# Altium schematic sheet 2.电源.SchDoc
size 297 x 209 mm; SheetNumber: 2; SheetTotal: 13
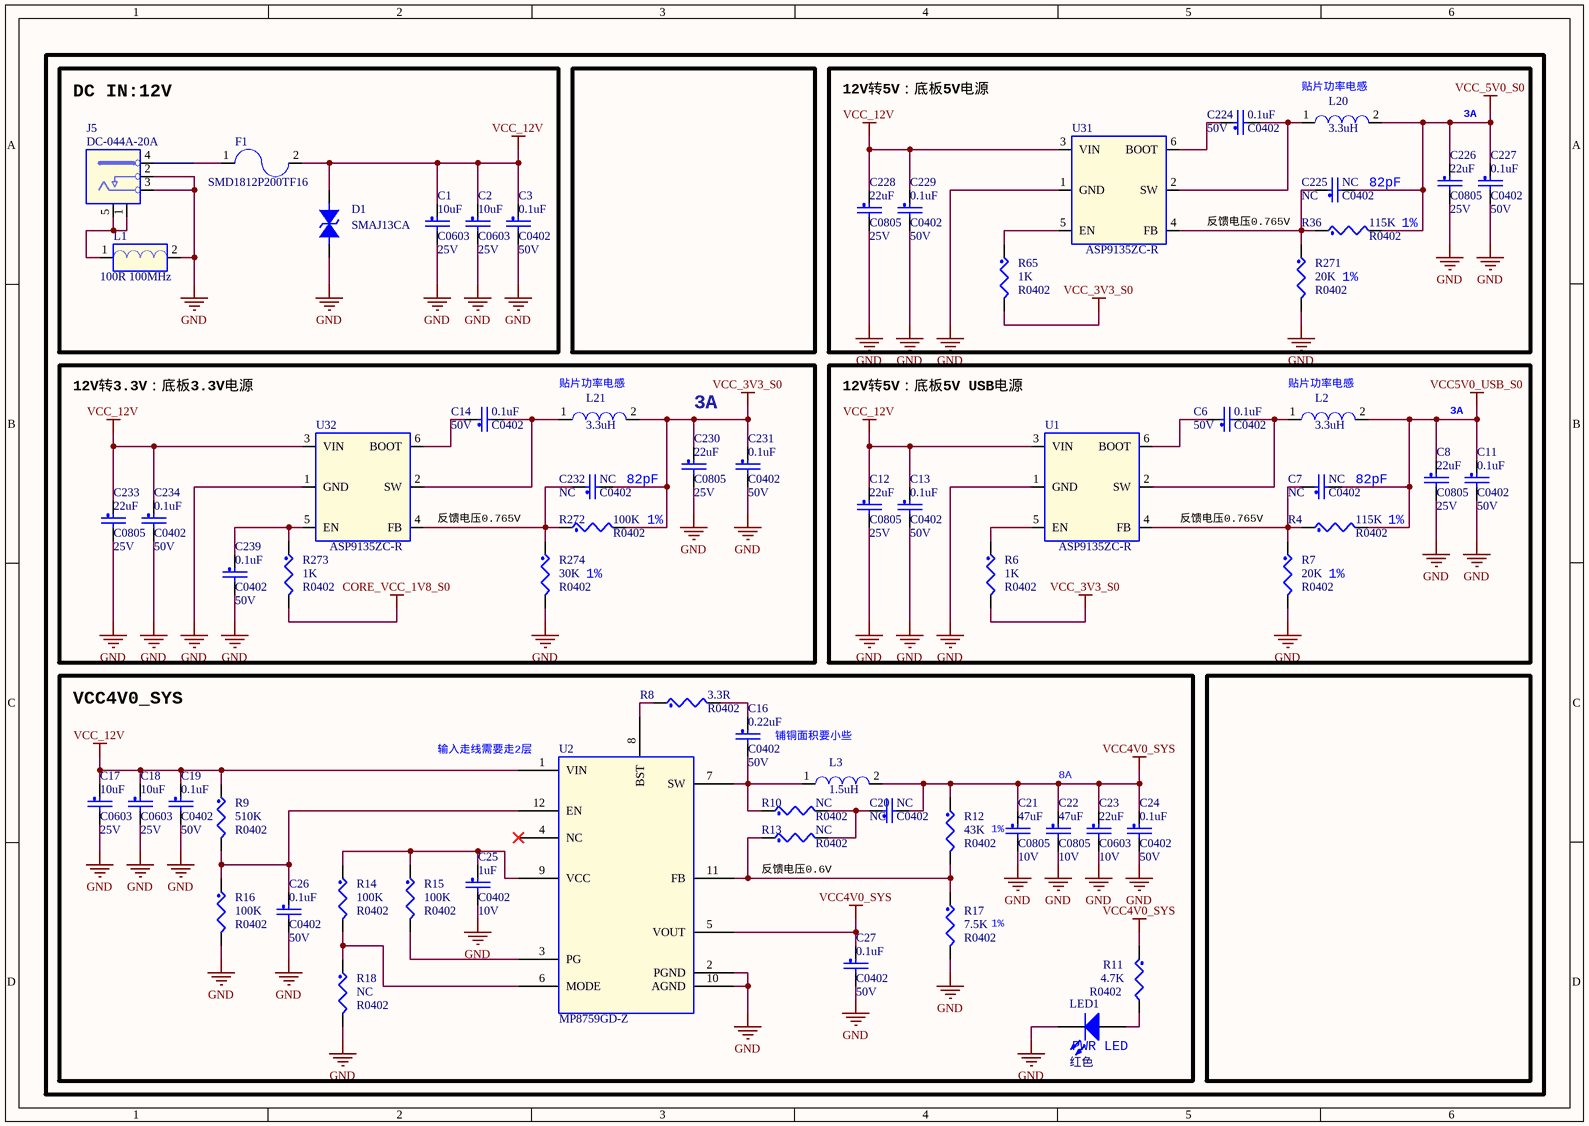
[diagram p0: 2.电源.SchDoc]

## Parts
C1  10uF  Voltage: 25V  [C0603]
C2  10uF  Voltage: 25V  [C0603]
C3  0.1uF  Voltage: 50V  [C0402]
C6  0.1uF  Voltage: 50V  [C0402]
C7  NC  [C0402]
C8  22uF  Voltage: 25V  [C0805]
C11  0.1uF  Voltage: 50V  [C0402]
C12  22uF  Voltage: 25V  [C0805]
C13  0.1uF  Voltage: 50V  [C0402]
C14  0.1uF  Voltage: 50V  [C0402]
C16  0.22uF  Voltage: 50V  [C0402]
C17  10uF  Voltage: 25V  [C0603]
C18  10uF  Voltage: 25V  [C0603]
C19  0.1uF  Voltage: 50V  [C0402]
C20  NC  [C0402]
C21  47uF  Voltage: 10V  [C0805]
C22  47uF  Voltage: 10V  [C0805]
C23  22uF  Voltage: 10V  [C0603]
C24  0.1uF  Voltage: 50V  [C0402]
C25  1uF  Voltage: 10V  [C0402]
C26  0.1uF  Voltage: 50V  [C0402]
C27  0.1uF  Voltage: 50V  [C0402]
C224  0.1uF  Voltage: 50V  [C0402]
C225  NC  [C0402]
C226  22uF  Voltage: 25V  [C0805]
C227  0.1uF  Voltage: 50V  [C0402]
C228  22uF  Voltage: 25V  [C0805]
C229  0.1uF  Voltage: 50V  [C0402]
C230  22uF  Voltage: 25V  [C0805]
C231  0.1uF  Voltage: 50V  [C0402]
C232  NC  [C0402]
C233  22uF  Voltage: 25V  [C0805]
C234  0.1uF  Voltage: 50V  [C0402]
C239  0.1uF  Voltage: 50V  [C0402]
D1  SMAJ13CA  [SMA_CA]
F1  SMD1812P200TF16  [F1812]
J5  DC-044A-20A  [dc_in_th_3p_10r1x11r6]
L1  100R 100MHz  [L0603]
L2  3.3uH  [l4520]
L3  1.5uH  [L0518]
L20  3.3uH  [l4520]
L21  3.3uH  [l4520]
LED1  红色  [LED0603_R]
R4  115K  [R0402]
R6  1K  [R0402]
R7  20K  [R0402]
R8  3.3R  [R0402]
R9  510K  [R0402]
R10  NC  [R0402]
R11  4.7K  [R0402]
R12  43K  [R0402]
R13  NC  [R0402]
R14  100K  [R0402]
R15  100K  [R0402]
R16  100K  [R0402]
R17  7.5K  [R0402]
R18  NC  [R0402]
R36  115K  [R0402]
R65  1K  [R0402]
R271  20K  [R0402]
R272  100K  [R0402]
R273  1K  [R0402]
R274  30K  [R0402]
U1  ASP9135ZC-R  [SOT23_6]
U2  MP8759GD-Z  [QFN12-2R00X3R00]
U31  ASP9135ZC-R  [SOT23_6]
U32  ASP9135ZC-R  [SOT23_6]

## Blocks framed on the sheet
DC IN:12V: C1-C3 D1 F1 J5 L1
12V转5V：底板5V电源: C224-C229 L20 R36 R65 R271 U31
3A: C14 C230-C234 C239 L21 R272-R274 U32
12V转5V：底板5V USB电源: C6-C8 C11-C13 L2 R4 R6 R7 U1
VCC4V0_SYS: C16-C27 L3 LED1 R8-R18 U2

## Nets
CORE_VCC_1V8_S0: R273.2
GND: C1.2 C2.2 C3.2 C8.2 C11.2 C12.2 C13.2 C17.2 C18.2 C19.2 C21.2 C22.2 C23.2 C24.2 C25.2 C26.2 C27.2 C226.2 C227.2 C228.2 C229.2 C230.2 C231.2 C233.2 C234.2 C239.2 D1.1 J5.2 J5.3 L1.2 LED1.2(K) R7.2 R16.2 R17.2 R18.2 R271.2 R274.2 U1.1(GND) U2.2(PGND) U2.10(AGND) U31.1(GND) U32.1(GND)
VCC4V0_SYS: C20.2 C21.1 C22.1 C23.1 C24.1 C27.1 L3.2 R11.1 R12.1 U2.5(VOUT)
VCC5V0_USB_S0: C7.2 C8.1 C11.1 L2.2 R4.2
VCC_3V3_S0: C230.1 C231.1 C232.2 L21.2 R6.2 R65.2 R272.2
VCC_5V0_S0: C225.2 C226.1 C227.1 L20.2 R36.2
VCC_12V: C1.1 C2.1 C3.1 C12.1 C13.1 C17.1 C18.1 C19.1 C228.1 C229.1 C233.1 C234.1 D1.2 F1.2 R9.1 U1.3(VIN) U2.1(VIN) U31.3(VIN) U32.3(VIN)
NetC6_1: C6.1 U1.6(BOOT)
NetC6_2: C6.2 L2.1 U1.2(SW)
NetC7_1: C7.1 R4.1 R7.1 U1.4(FB)
NetC14_1: C14.1 U32.6(BOOT)
NetC14_2: C14.2 L21.1 U32.2(SW)
NetC16_1: C16.1 R8.2
NetC16_2: C16.2 L3.1 R10.1 U2.7(SW)
NetC20_1: C20.1 R10.2 R13.2
NetC25_1: C25.1 R14.1 R15.1 U2.9(VCC)
NetC26_1: C26.1 R9.2 R16.1 U2.12(EN)
NetC224_1: C224.1 U31.6(BOOT)
NetC224_2: C224.2 L20.1 U31.2(SW)
NetC225_1: C225.1 R36.1 R271.1 U31.4(FB)
NetC232_1: C232.1 R272.1 R274.1 U32.4(FB)
NetC239_1: C239.1 R273.1 U32.5(EN)
NetF1_1: F1.1 J5.4
NetJ5_1: J5.1 J5.5 L1.1
NetLED1_1: LED1.1(A) R11.2
NetR6_1: R6.1 U1.5(EN)
NetR8_1: R8.1 U2.8(BST)
NetR12_2: R12.2 R13.1 R17.1 U2.11(FB)
NetR14_2: R14.2 R18.1 U2.6(MODE)
NetR15_2: R15.2 U2.3(PG)
NetR65_1: R65.1 U31.5(EN)

Not connected (* = marked no-connect by the designer): U2 4(NC)*

## Notes on the sheet
- (near L20) 贴片功率电感
- 3A
- 82pF
- 反馈电压0.765V
- 1%
- 12V转3.3V：底板3.3V电源
- (near L21) 贴片功率电感
- (near L2) 贴片功率电感
- (near U32) 反馈电压0.765V
- 铺铜面积要小些
- 输入走线需要走2层
- 8A
- (near R13) 反馈电压0.6V
- (near C21) 1%
- (near R17) 1%
- (near LED1) PWR LED

## Library data of the parts
C1 C2 C17 C18 = CAP_NP: CLASS: DISCRETE; 生命周期: 量产; 价格: 0.109811; 规格书: 三星电容.pdf; 类别: 贴片电容0603; 品牌: 三星; 条码: EBF29060171; 规格编号: CL10A106MA8NRNC; 规格: 贴片电容10uF 20% 25V X5R 0603; PCB Footprint: C0603
C3 C24 C27 C229 = CAP_NP: CLASS: DISCRETE; 规格: 贴片电容0.1uF 10% 50V X5R 0402; 规格编号: 0402X104K500NT; 条码: EBF29060118; 品牌: 风华; 类别: 贴片电容0402; 规格书: 风华电容.pdf; 价格: 0.029826; 生命周期: 量产; PCB Footprint: C0402
C6 C11 C13 C14 C19 C26 C224 C227 C231 C234 C239 = CAP_NP: CLASS: DISCRETE; 生命周期: 量产; 价格: 0.029826; 规格书: 风华电容.pdf; 类别: 贴片电容0402; 品牌: 风华; 条码: EBF29060118; 规格编号: 0402X104K500NT; 规格: 贴片电容0.1uF 10% 50V X5R 0402; PCB Footprint: C0402
C7 C20 C225 C232 = CAP_NP: CLASS: DISCRETE; 规格: 贴片电容NC 预留; 条码: EBF29060149; 类别: 贴片电容0402; Voltage: NC; PCB Footprint: C0402
C8 C12 C226 C230 C233 = CAP_NP: CLASS: DISCRETE; 规格: 贴片电容22uF 20% 25V X5R 0805; 规格编号: 0805X226M250NT; 条码: EBF29060173; 品牌: 风华; 类别: 贴片电容0805; 规格书: 风华电容.pdf; 价格: 0.285631; 生命周期: 量产; PCB Footprint: C0805
C16 = CAP_NP: CLASS: DISCRETE; 生命周期: 量产; 价格: 0.074942; 规格书: 太诱-贴片电容.pdf; 类别: 贴片电容0402; 品牌: 太诱; 条码: EBF29060266; 规格编号: UMK105BJ224MV-F; 规格: 贴片电容0.22uF 20% 50V X5R 0402; PCB Footprint: C0402
C21 = CAP_NP: CLASS: DISCRETE; 规格: 贴片电容47uF 20% 10V X5R 0805; 规格编号: 0805X476M100NT; 条码: EBF29060212; 品牌: 风华; 类别: 贴片电容0805; 规格书: 风华电容.pdf; 价格: 0.368494; 生命周期: 量产; PCB Footprint: C0805
C22 = CAP_NP: CLASS: DISCRETE; 生命周期: 量产; 价格: 0.368494; 规格书: 风华电容.pdf; 类别: 贴片电容0805; 品牌: 风华; 条码: EBF29060212; 规格编号: 0805X476M100NT; 规格: 贴片电容47uF 20% 10V X5R 0805; PCB Footprint: C0805
C23 = CAP_NP: CLASS: DISCRETE; 生命周期: 量产; 价格: 0.078818; 规格书: 三星电容.pdf; 类别: 贴片电容0603; 品牌: 三星; 条码: EBF29060163; 规格编号: CL10A226MP8NUNE; 规格: 贴片电容22uF 20% 10V X5R 0603; PCB Footprint: C0603
C25 = CAP_NP: CLASS: DISCRETE; 规格: 贴片电容1uF 10% 10V X5R 0402; 规格编号: 0402X105K100NT; 条码: EBF29060121; 品牌: 风华; 类别: 贴片电容0402; 规格书: 风华电容.pdf; 价格: 0.01191; 生命周期: 量产; PCB Footprint: C0402
C228 = CAP_NP: CLASS: DISCRETE; 生命周期: 量产; 价格: 0.285631; 规格书: 风华电容.pdf; 类别: 贴片电容0805; 品牌: 风华; 条码: EBF29060173; 规格编号: 0805X226M250NT; 规格: 贴片电容22uF 20% 25V X5R 0805; PCB Footprint: C0805
D1 = DIODE BI-DIR TRIG: 规格: TVS二极管 箝位电压21.5V 击穿电压14.4V 反向关断电压13V; 条码: EBF29140049; 品牌: 伯恩半导体; 类别: 贴片TVS; 规格书: 伯恩半导体-SMAJ13CA.pdf; 价格: 0.181964; 生命周期: 量产; 规格编号: SMAJ13CA; PCB Footprint: SMA_CA
F1 = FUSE: 规格: 自恢复保险丝 最大电压46V 最大电流100A 保持电流2A 跳闸电流4A; 条码: EBF29270006; 品牌: 瑞隆源; 类别: 自恢复保险丝; 规格书: 瑞隆源-自恢复保险丝.pdf; 价格: 0.385618; 生命周期: 量产; 规格编号: SMD1812P200TF16; PCB Footprint: F1812
J5 = DC-044A-20A: 生命周期: 量产; 规格书: DC插座_内径_2MM外径_5.9MM.pdf; 类别: DC电源座; 条码: EBF29040093; 规格编号: DC-044A-20A DC; 规格: DC-044A-20A DC插座; PCB Footprint: dc_in_th_3p_10r1x11r6
L1 = BEAD: CLASS: DISCRETE; 规格: 磁珠100Ω @100MHz 额定电流3A 直流电阻30mΩ; 规格编号: UPZ1608E101-3R0TF; 条码: EBF29050038; 品牌: 顺络; 类别: 贴片磁珠0603; 规格书: 顺络-磁珠.pdf; 价格: 0.021567; 生命周期: 量产; PCB Footprint: L0603
L2 = IND: CLASS: DISCRETE; 价格: 1.5992; 规格编号: TMPC0402HP-3R3MG-Z02; 规格: 贴片电感3.3uH ±20% 3A 直流电阻69mΩ; 条码: EBF29050040; 品牌: 台庆; 类别: 贴片电感0402; 规格书: 台庆-功率电感.pdf; 生命周期: 量产; PCB Footprint: l4520
L3 = IND: CLASS: DISCRETE; 生命周期: 量产; 价格: 0.525895; 规格书: 长江微电_FXL0518-1R5-M.pdf; 类别: 贴片电感SMD; 品牌: 长江微电; 条码: EBFCIS221116170516; 规格编号: FXL0518-1R5-M; 规格: 贴片电感1.5uH ±20% 7.5A 直流电阻25mΩ; PCB Footprint: L0518
L20 = IND: CLASS: DISCRETE; 价格: 1.5992; 规格编号: TMPC0402HP-3R3MG-Z02; 生命周期: 量产; 规格书: 台庆-功率电感.pdf; 类别: 贴片电感0402; 品牌: 台庆; 条码: EBF29050040; 规格: 贴片电感3.3uH ±20% 3A 直流电阻69mΩ; PCB Footprint: l4520
L21 = IND: CLASS: DISCRETE; 规格: 贴片电感3.3uH ±20% 3A 直流电阻69mΩ; 条码: EBF29050040; 品牌: 台庆; 类别: 贴片电感0402; 规格书: 台庆-功率电感.pdf; 生命周期: 量产; 规格编号: TMPC0402HP-3R3MG-Z02; 价格: 1.5992; PCB Footprint: l4520
LED1 = LED: 贴片LED; 封装库来自淘宝卖家：黄晶宝石: 其他店铺购入均为盗版封装库，无更新权益，请立即申请退款，本店现金奖励200~1000元; BOM名称: 贴片LED
R4 R36 = RES: CLASS: DISCRETE; 生命周期: 量产; 价格: 0.006087; 规格书: YAGEO国巨厚膜无铅电阻.pdf; 类别: 贴片电阻0402; 品牌: 国巨; 条码: EBF29070290; 规格编号: AC0402FR-07115KL; 规格: 贴片电阻115K 1% 1/16W 0402; PCB Footprint: R0402
R6 = RES: CLASS: DISCRETE; 规格: 贴片电阻1K 1% 1/16W 0402; 规格编号: RI0402L1001FT; 条码: EBF29070050; 品牌: 合科泰; 类别: 贴片电阻0402; 规格书: 合科泰-RI系列电阻.pdf; 生命周期: 量产; PCB Footprint: R0402
R7 R271 = RES: CLASS: DISCRETE; 生命周期: 量产; 价格: 0.002473; 规格书: 厚声-无铅厚膜电阻.pdf; 类别: 贴片电阻0402; 品牌: 厚声; 条码: EBF29070223; 规格编号: 0402WGF2002TCE; 规格: 贴片电阻20K 1% 1/16W 0402; PCB Footprint: R0402
R8 = RES: CLASS: DISCRETE; 规格: 贴片电阻3.3R 1% 1/16W 0402; 规格编号: 0402WGF330KTCE; 条码: EBFCIS221116113428; 品牌: 厚声; 类别: 贴片电阻0402; 规格书: 厚声-无铅厚膜电阻.pdf; 价格: 0.003117; 生命周期: 量产; PCB Footprint: R0402
R9 = RES: CLASS: DISCRETE; 规格: 贴片电阻510K 1% 1/16W 0402; 规格编号: RI0603L5103FT; 条码: EBF29070241; 品牌: 合科泰; 类别: 贴片电阻0402; 规格书: 合科泰-RI系列电阻.pdf; 生命周期: 量产; PCB Footprint: R0402
R10 R13 = RES: CLASS: DISCRETE; 类别: 贴片电阻0402; 条码: EBF29070087; 规格: 贴片电阻NC 预留; PCB Footprint: R0402
R11 = RES: CLASS: DISCRETE; 规格: 贴片电阻4.7K 1% 1/16W 0402; 规格编号: RI0402L4701FT; 条码: EBF29070047; 品牌: 合科泰; 类别: 贴片电阻0402; 规格书: 合科泰-RI系列电阻.pdf; 生命周期: 量产; PCB Footprint: R0402
R12 = RES: CLASS: DISCRETE; 规格: 贴片电阻43K 1% 1/16W 0402; 规格编号: AC0402FR-0743KL; 条码: EBF29070011; 品牌: 国巨; 类别: 贴片电阻0402; 规格书: YAGEO国巨厚膜无铅电阻.pdf; 价格: 0.00683; 生命周期: 量产; PCB Footprint: R0402
R14 = RES: CLASS: DISCRETE; 生命周期: 量产; 规格书: 合科泰-RI系列电阻.pdf; 类别: 贴片电阻0402; 品牌: 合科泰; 条码: EBF29070054; 规格编号: RI0402L1003FT; 规格: 贴片电阻100K 1% 1/16W 0402; PCB Footprint: R0402
R15 R16 R272 = RES: CLASS: DISCRETE; 规格: 贴片电阻100K 1% 1/16W 0402; 规格编号: RI0402L1003FT; 条码: EBF29070054; 品牌: 合科泰; 类别: 贴片电阻0402; 规格书: 合科泰-RI系列电阻.pdf; 生命周期: 量产; PCB Footprint: R0402
R17 = RES: CLASS: DISCRETE; 规格: 贴片电阻7.5K 1% 1/16W 0402; 规格编号: 0402WGF7501TCE; 条码: EBFCIS221112140245; 品牌: 厚声; 类别: 贴片电阻0402; 规格书: 厚声-无铅厚膜电阻.pdf; 价格: 0.001521; 生命周期: 量产; PCB Footprint: R0402
R18 = RES: CLASS: DISCRETE; 规格: 贴片电阻NC 预留; 条码: EBF29070087; 类别: 贴片电阻0402; PCB Footprint: R0402
R65 R273 = RES: CLASS: DISCRETE; 生命周期: 量产; 规格书: 合科泰-RI系列电阻.pdf; 类别: 贴片电阻0402; 品牌: 合科泰; 条码: EBF29070050; 规格编号: RI0402L1001FT; 规格: 贴片电阻1K 1% 1/16W 0402; PCB Footprint: R0402
R274 = RES: CLASS: DISCRETE; 规格: 贴片电阻30K 1% 1/16W 0402; 规格编号: RI0402L3002FT; 条码: EBF29070048; 品牌: 合科泰; 类别: 贴片电阻0402; 规格书: 合科泰-RI系列电阻.pdf; 生命周期: 量产; PCB Footprint: R0402
U1 = TP6327GS6: 规格: DC-DC电源芯片 可输出电流 3A 开关工作频率 600kHz 输出类型 ADJ 输入电压范围：4V-18V; 条码: EBFCIS240710113940; 品牌: 安森德; 类别: 电源管理-DCDC; 规格书: 安森德_ASP9135ZC-R.pdf; 生命周期: 量产; 备注: RK3566金手指与BTB底板替换物料; 规格编号: ASP9135ZC-R; 可替代料: TP6327GS6; PCB Footprint: SOT23_6
U2 = MP8759GD-Z: 生命周期: 量产; 价格: 3.2; 规格书: MPS_MP8759GD-Z.pdf; 类别: 电源管理-DCDC; 品牌: MPS; 条码: EBFCIS221112174800; 规格: DC-DC电源芯片 输入：4.5V-26V 电流：8A 频率: 固定700KHz频率  FB：0.6V; 规格编号: MP8759GD-Z; PCB Footprint: QFN12-2R00X3R00
U31 U32 = TP6327GS6: 备注: RK3566金手指与BTB底板替换物料; 生命周期: 量产; 规格书: 安森德_ASP9135ZC-R.pdf; 类别: 电源管理-DCDC; 品牌: 安森德; 条码: EBFCIS240710113940; 规格: DC-DC电源芯片 可输出电流 3A 开关工作频率 600kHz 输出类型 ADJ 输入电压范围：4V-18V; 可替代料: TP6327GS6; 规格编号: ASP9135ZC-R; PCB Footprint: SOT23_6